# EasyEDA Pro project 稳流源电路板_2026-10-23.epro

# Schematic DC-DC-CV-学生版
Board Name: 稳压源; Create Date: 2025-10-15; Page Name: DC-DC-CV; Project Name: 3A稳压源_学生版; Schematic Name: DC-DC-CV-学生版; Update Date: 2025-10-15; Company: 嘉立创EDA; Page Size: A4; Version: V1.0
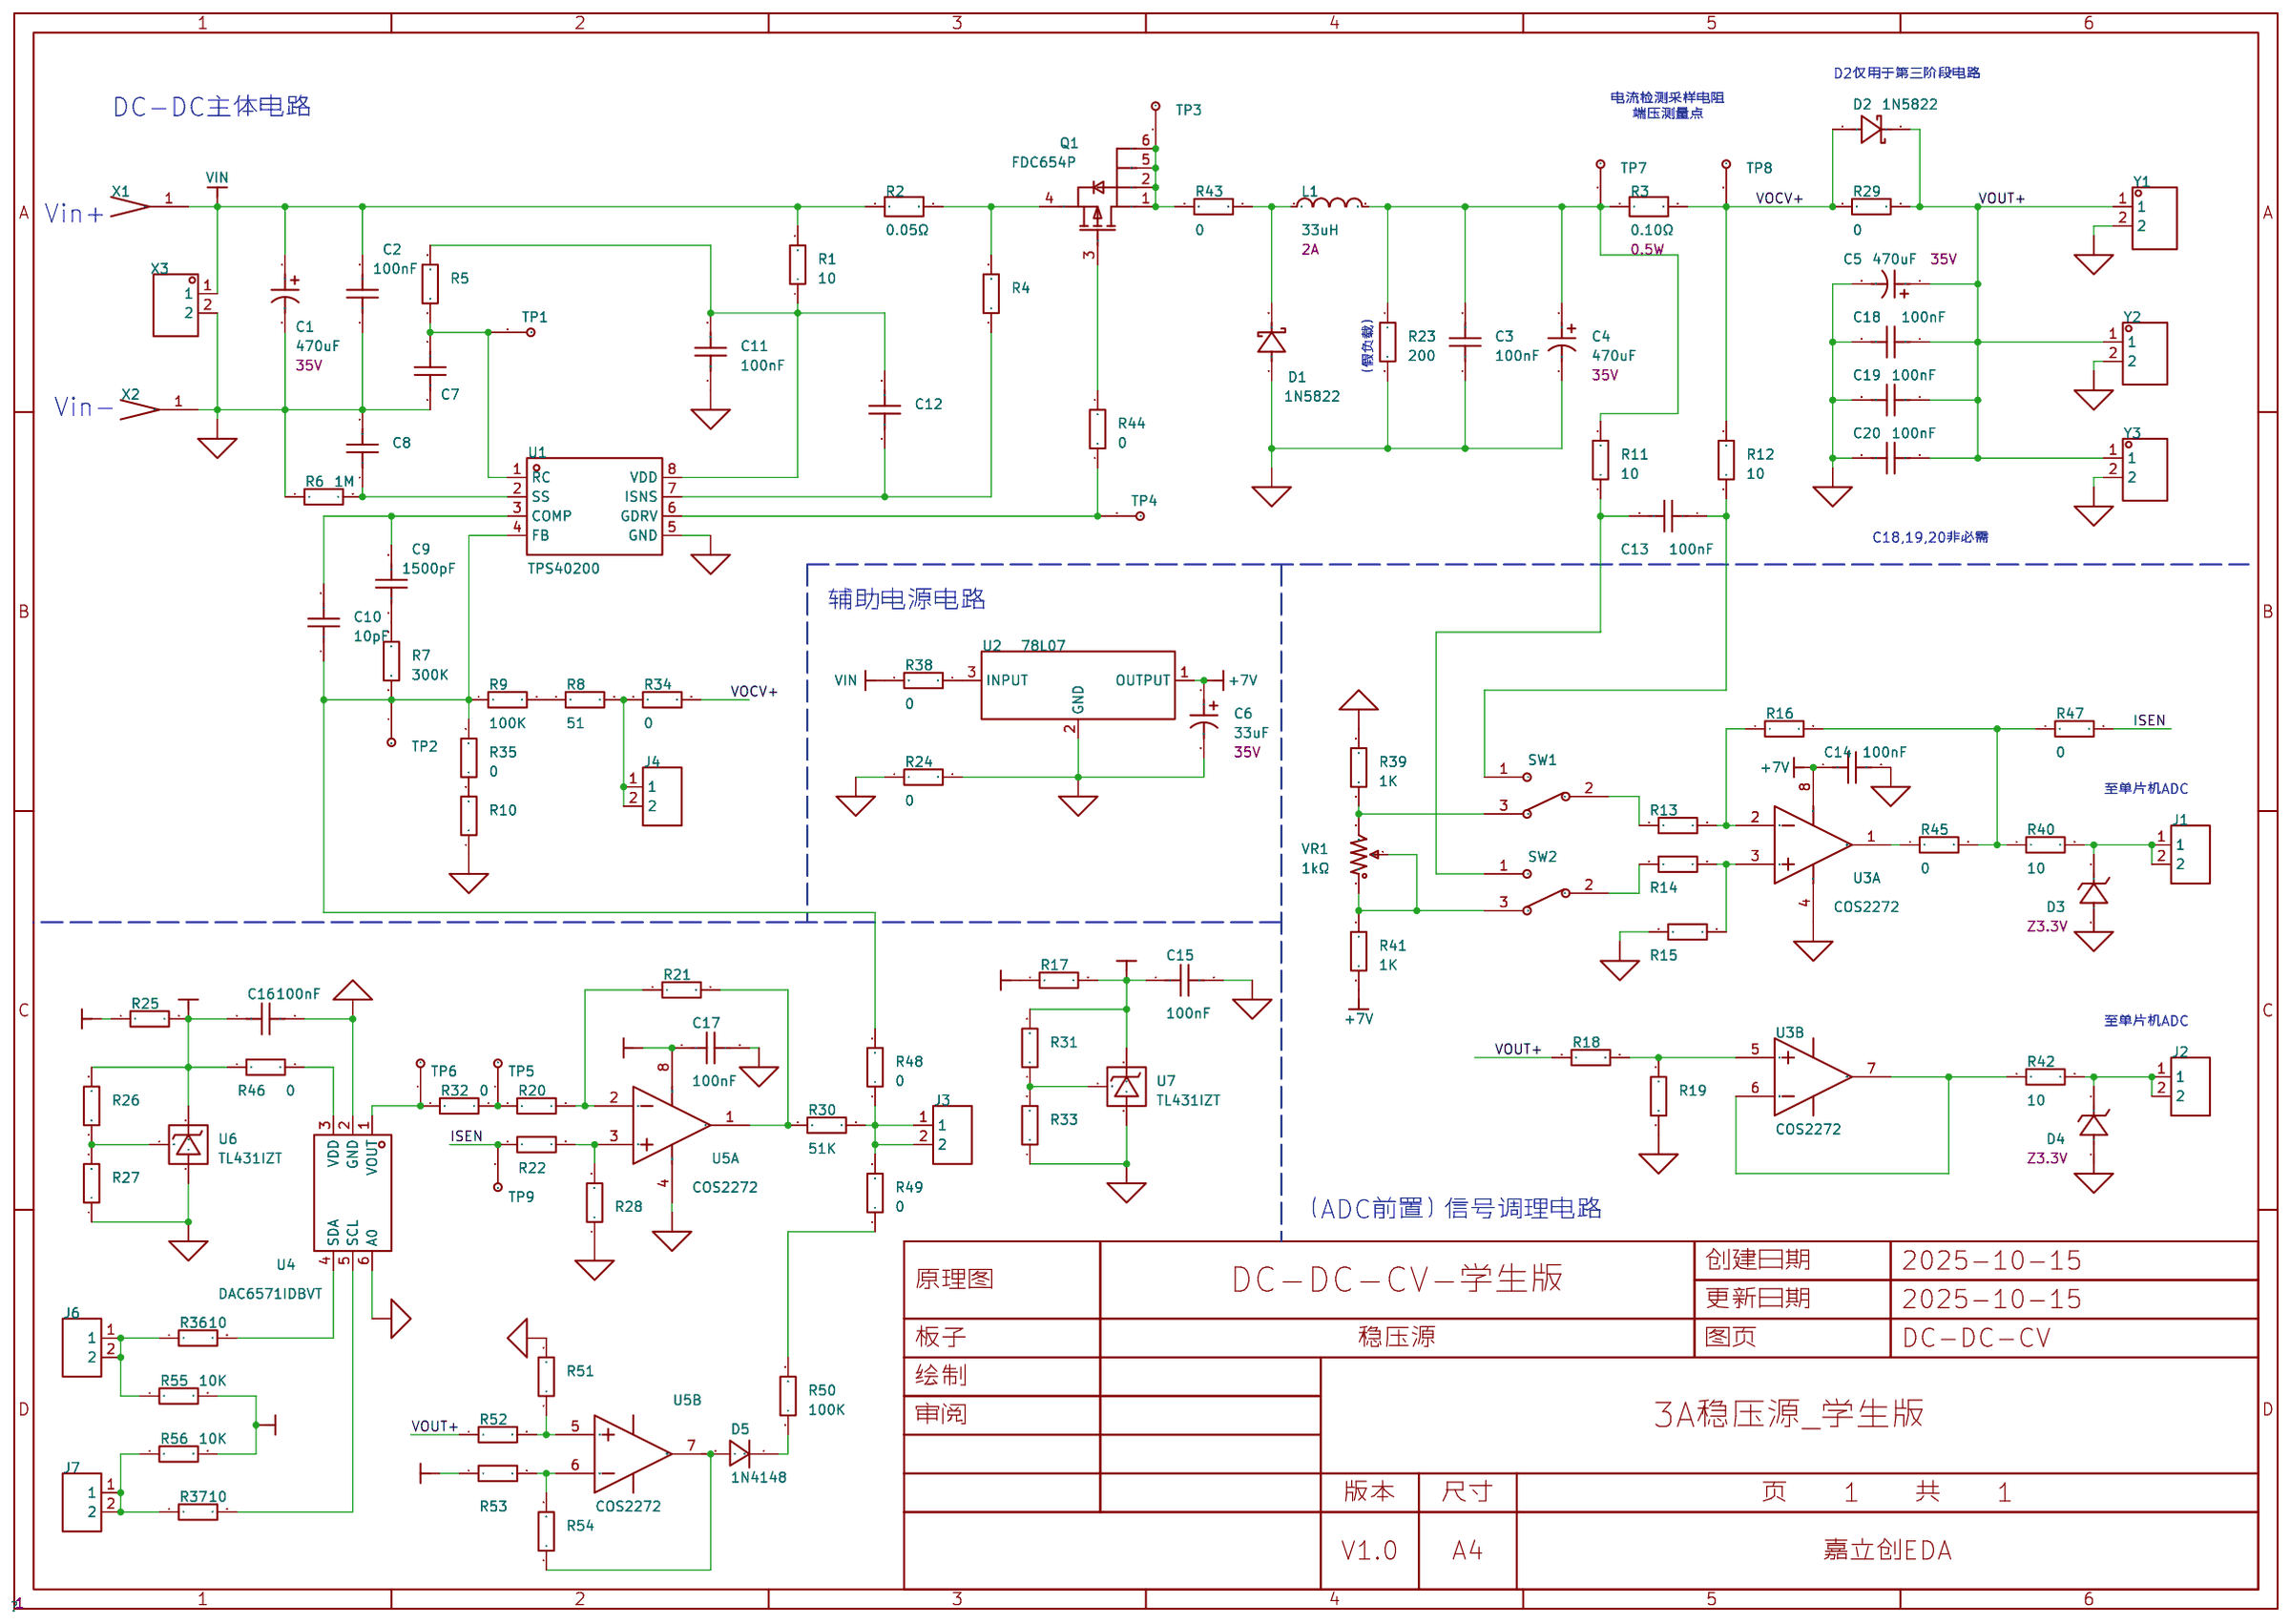
[diagram p0: schematic sheet]

## Parts
C1  470uF  [CAP-TH_BD10.0-P5.00-D0.6-FD]
C2  100nF  [C0805]
C3  100nF  [C0805]
C4  470uF  [CAP-TH_BD10.0-P5.00-D0.6-FD]
C5  470uF  [CAP-TH_BD10.0-P5.00-D0.6-FD]
C6  33uF  [CAP-TH_BD10.0-P5.00-D0.6-FD]
C7  100nF  [C0805]
C8  100nF  [C0805]
C9  1500pF  [C0805]
C10  10pF  [C0805]
C11  100nF  [C0805]
C12  100nF  [C0805]
C13  100nF  [C0805]
C14  100nF  [C0805]
C15  100nF  [C0805]
C16  100nF  [C0805]
C17  100nF  [C0805]
C18  100nF  [C0805]
C19  100nF  [C0805]
C20  100nF  [C0805]
D1  1N5822  [DO-201AD_BD5.3-L8.4-P12.50-D1.4-FD]
D2  1N5822  [DO-201AD_BD5.3-L8.4-P12.50-D1.4-FD]
D3  1N5937BRLG  [DO-41_BD2.4-L4.7-P8.70-D0.9-RD]
D4  1N5937BRLG  [DO-41_BD2.4-L4.7-P8.70-D0.9-RD]
D5  1N4148  [DO-35_BD2.0-L4.2-P8.20-D0.5-RD]
J1  PZ254V-11-02P  [HDR-TH_2P-P2.54-V-M]
J2  PZ254V-11-02P  [HDR-TH_2P-P2.54-V-M]
J3  PZ254V-11-02P  [HDR-TH_2P-P2.54-V-M]
J4  PZ254V-11-02P  [HDR-TH_2P-P2.54-V-M]
J6  PZ254V-11-02P  [HDR-TH_2P-P2.54-V-M]
J7  PZ254V-11-02P  [HDR-TH_2P-P2.54-V-M]
L1  33uH  [IND-SMD_L12.3-W12.3]
Q1  FDC654P  [SOT-23-6_L2.9-W1.6-P0.95-LS2.8-BL]
R1  10  [R0805]
R2  0.05Ω  [R2512]
R3  0.10Ω  [R2512]
R4  10K  [R0805]
R5  10K  [R0805]
R6  1M  [R0805]
R7  300K  [R0805]
R8  51  [R0805]
R9  100K  [R0805]
R10  10K  [R0805]
R11  10  [R0805]
R12  10  [R0805]
R13  10K  [R0805]
R14  10K  [R0805]
R15  10K  [R0805]
R16  10K  [R0805]
R17  10K  [R0805]
R18  10K  [R0805]
R19  10K  [R0805]
R20  10K  [R0805]
R21  10K  [R0805]
R22  10K  [R0805]
R23  200  [R0805]
R24  0  [R0805]
R25  10K  [R0805]
R26  10K  [R0805]
R27  10K  [R0805]
R28  10K  [R0805]
R29  0  [R0805]
R30  51K  [R0805]
R31  10K  [R0805]
R32  0  [R0805]
R33  10K  [R0805]
R34  0  [R0805]
R35  0  [R0805]
R36  10  [R0805]
R37  10  [R0805]
R38  0  [R0805]
R39  1K  [R0805]
R40  10  [R0805]
R41  1K  [R0805]
R42  10  [R0805]
R43  0  [R0805]
R44  0  [R0805]
R45  0  [R0805]
R46  0  [R0805]
R47  0  [R0805]
R48  0  [R0805]
R49  0  [R0805]
R50  100K  [R0805]
R51  10K  [R0805]
R52  10K  [R0805]
R53  10K  [R0805]
R54  10K  [R0805]
R55  10K  [R0805]
R56  10K  [R0805]
SW1  -  [3PIN]
SW2  -  [3PIN]
TP1  -  [1PIN]
TP2  -  [1PIN]
TP3  -  [1PIN]
TP4  -  [1PIN]
TP5  -  [1PIN]
TP6  -  [1PIN]
TP7  -  [1PIN]
TP8  -  [1PIN]
TP9  -  [1PIN]
U1  TPS40200  [SOIC-8_L4.9-W3.9-P1.27-LS6.0-BL]
U2  78L07  [TO-92-3_L4.8-W3.7-P1.27-L]
U3  COS2272  [SOIC-8_L4.9-W3.9-P1.27-LS6.0-BL]  (sections 1,2)
U4  DAC6571IDBVT  [SOT-23-6_L2.9-W1.6-P0.95-LS2.8-BL]
U5  COS2272  [SOIC-8_L4.9-W3.9-P1.27-LS6.0-BL]  (sections 1,2)
U6  TL431IZT  [TO-92-3_L5.1-W4.1-P1.27-L]
U7  TL431IZT  [TO-92-3_L5.1-W4.1-P1.27-L]
VR1  1kΩ  [RES-ADJ-TH_3P-L10.0-W10.0-P2.50-BL-BS]
X1  -  [HOLE6-13]
X2  -  [HOLE6-13]
X3  WJ2EDGV-5.08-2P  [CONN-TH_WJ2EDGV-5.08-2P]
Y1  WJ2EDGV-5.08-2P  [CONN-TH_WJ2EDGV-5.08-2P]
Y2  WJ2EDGV-5.08-2P  [CONN-TH_WJ2EDGV-5.08-2P]
Y3  WJ2EDGV-5.08-2P  [CONN-TH_WJ2EDGV-5.08-2P]

## Library data of the parts
C1 C4-C6 = EKZE350ELL471MJ20S: 容值:470uF;精度:±20%;额定电压:35V;纹波电流:-;等效串联电阻:-;; LCSC Part Name: 470uF ±20% 35V; Supplier Part: C1579354; Manufacturer: NCC(日本贵弥功); Supplier Footprint: 插件,D10xL20mm; JLCPCB Part Class: 扩展库; Datasheet: https://atta.szlcsc.com/upload/public/pdf/source/20210702/C1579354_DE4BD1676235DEE98D4DD079E73A87D2.pdf; Supplier: LCSC; Tolerance: ±20%; Rated Voltage: 35V
C2 C3 C7-C20 = CAP_0805: Supplier Footprint: 0805
D1 D2 = 1N5822_C27636119: Supplier Part: C27636119; Manufacturer: DOWO(东沃); Supplier Footprint: DO-201AD; JLCPCB Part Class: 扩展库; Datasheet: https://atta.szlcsc.com/upload/public/pdf/source/20240708/778E8DD7D26CDCB4892658A16A41E3F5.pdf; Supplier: LCSC
D3 D4 = 1N5937BRLG: 稳压值(标称值):33V;功率(Pd):3W;; Supplier Part: C896122; Manufacturer: onsemi(安森美); Supplier Footprint: 插件; JLCPCB Part Class: 扩展库; Datasheet: https://atta.szlcsc.com/upload/public/pdf/source/20221020/F23089D807D0452AE77C34D51C0B0686.pdf; Supplier: LCSC; Zener Voltage (Nom): 33V; Reverse Leakage Current (Ir): 1uA@25.1V; Power Dissipation: 3W; Zener Impedance (Zzt): 33Ω; Comment: Z3.3V
D5 = 1N4148_C402212: 二极管配置:-;正向压降(Vf):1V@10mA;直流反向耐压(Vr):75V;整流电流:150mA;反向恢复时间(Trr):4ns;; LCSC Part Name: 75V 150mA; Supplier Part: C402212; Manufacturer: LGE(鲁光); Supplier Footprint: DO-35; JLCPCB Part Class: Extended Part; Datasheet: https://item.szlcsc.com/datasheet/1N4148/387357.html; Supplier: LCSC; Voltage - Forward(Vf@If): 1V@10mA; Voltage - DC Reverse(Vr): 75V; Current - Rectified: 150mA; Pd - Power Dissipation: 500mW; Reverse Leakage Current (Ir): 5uA@75V; Reverse Recovery Time (trr): 4ns; Non-Repetitive Peak Forward Surge Current: 2A
J1-J4 J6 J7 = PZ254V-11-02P: 插针结构:1x2P;间距:2.54mm;行距:-;圆针/方针:方针;安装方式:直插;排数:单排;总PIN位数:2P;额定电流:-;额定电压:-;配合针长度:6mm;塑高:2.5mm;端接针长度:3mm;触头材质:黄铜;触头镀层:-;工作温度:-40℃~+105℃;颜色:黑色;; LCSC Part Name: 1x2P 间距:2.54mm 方针 直插; Supplier Part: C492401; Manufacturer: XFCN(兴飞); Supplier Footprint: 插件,P=2.54mm; JLCPCB Part Class: 扩展库; Datasheet: https://atta.szlcsc.com/upload/public/pdf/source/20200309/C492401_A812433581A9B211A7FFA413ADDFF0E5.pdf; Supplier: LCSC; Pin Structure: 1x2P; Pitch: 2.54mm; Circluar Pins/Square Pins: 方针; Mounting Type: 直插; Number of Rows: 单排; Number of Pins: 2P; Length of Mating Pin: 6mm; Insulation Height: 2.5mm; Length of End Connection Pin: 3mm; Contact Material: 黄铜; Operating Temperature: -40℃~+105℃; Color: 黑色
L1 = SMDRI127-330MT: 电感值:33uH;精度:±20%;额定电流:3A;饱和电流(Isat):5.5A;类型:屏蔽电感;; LCSC Part Name: 33uH ±20% 5.5A; Supplier Part: C9400; Manufacturer: SXN(顺翔诺); Supplier Footprint: SMD,12.3x12.3mm; JLCPCB Part Class: 扩展库; Datasheet: https://atta.szlcsc.com/upload/public/pdf/source/20210810/6F96FDC19AA308DD2AD166FFB9640E87.pdf; Supplier: LCSC; Tolerance: ±20%; Rated Current: 2A; Saturation Current (Isat): 5.5A; DC Resistance (DCR): 65mΩ; Type: 屏蔽电感
Q1 = TPFDC654P: Supplier Part: C5246409; Manufacturer: TECH PUBLIC(台舟); Supplier Footprint: SOT-23-6; JLCPCB Part Class: Extended Part; Datasheet: https://atta.szlcsc.com/upload/public/pdf/source/20221103/A89DD7696F31491652C9E5A0C36A9DE5.pdf; Supplier: LCSC
R1 R4-R56 = Res_0805: Supplier Footprint: 0805
R2 = JER2512F3R050: 电阻类型:采样电阻;阻值:50mΩ;精度:±1%;功率:3W;温度系数:±50ppm/℃;; LCSC Part Name: 50mΩ 3W 2512 ±1%; Supplier Part: C46634452; Manufacturer: 捷而瑞; Supplier Footprint: 2512; JLCPCB Part Class: 扩展库; Datasheet: https://atta.szlcsc.com/upload/public/pdf/source/20250318/D554CC95569B02A455FAE3D181D671EA.pdf; Supplier: LCSC; Type: 采样电阻; Tolerance: ±1%; Power(Watts): 3W; Temperature Coefficient: ±50ppm/℃
R3 = RE2512F3R100: 电阻类型:采样电阻;阻值:100mΩ;精度:±1%;功率:3W;温度系数:±50ppm/℃;; LCSC Part Name: 100mΩ 3W 2512 ±1%; Supplier Part: C46961760; Manufacturer: 捷而瑞; Supplier Footprint: 2512; JLCPCB Part Class: 扩展库; Datasheet: https://atta.szlcsc.com/upload/public/pdf/source/20250325/401775B85EF7B3A580BC34DFED100CB2.pdf; Supplier: LCSC; Type: 采样电阻; Tolerance: ±1%; Power(Watts): 0.5W; Temperature Coefficient: ±50ppm/℃
SW1 SW2 = SW-3
TP1-TP9 = TESTPOINT
U1 = TPS40200D: 功能类型:降压型;输入电压:4.5V~52V;; Supplier Part: C1530060; Manufacturer: TI(德州仪器); Supplier Footprint: SOIC-8; JLCPCB Part Class: Extended Part; Datasheet: https://www.ti.com/cn/lit/gpn/tps40200; Supplier: LCSC; Function: 降压型; Input Voltage: 4.5V~52V; Switching Frequency: 500kHz; Operating Temperature: -40℃~+85℃@(TA); Synchronous Rectification: 否; Number of Outputs: 1; Topology: 降压式; Switch tube (built-in/external): 外置
U2 = UPC78L07J-T-A: Supplier Part: C3749755; Manufacturer: RENESAS(瑞萨)/IDT; JLCPCB Part Class: 扩展库; Supplier: LCSC
U3 U5 = TLV2372IDRG4: TLV2372 双路、16V、3MHz、RRIO 运算放大器; Supplier Part: C2058264; Manufacturer: TI(德州仪器); Supplier Footprint: SOIC-8; JLCPCB Part Class: 扩展库; Datasheet: https://www.ti.com/cn/lit/gpn/tlv2375; Supplier: LCSC
U4 = DAC6571IDBVT: 分辨率(位):10位;接口类型:I2C;工作电压:2.7V~5.5V;稳定时间:7us;积分非线性:0.5LSB;; LCSC Part Name: I2C接口、电压输出、10位数字模拟转换器; Supplier Part: C1554794; Manufacturer: TI(德州仪器); Supplier Footprint: SOT-23-6; JLCPCB Part Class: Extended Part; Datasheet: https://www.ti.com/cn/lit/gpn/dac6571; Supplier: LCSC; Resolution(Bits): 10位; Number of Channels: 1; Interface: I2C; Voltage - Supply: 2.7V~5.5V; Settling Time: 7us; Output Type: 电压-缓冲; Integral non - linearity: 0.5LSB; Operating Temperature: -40℃~+105℃; Power-On Reset: 内置; Sampling Rate: 188kHz; Data rate: 3.4MHz; Quiescent Current (Iq): 125uA
U6 U7 = TL431IZT: 输出类型:可调;工作电压:2.5V~36V;输出电压:2.495V~36V;输出电流:100mA;精度:±2%;; LCSC Part Name: 2.5V~36V 并联; Supplier Part: C2156686; Manufacturer: ST(意法半导体); Supplier Footprint: TO-92; JLCPCB Part Class: Extended Part; Datasheet: https://item.szlcsc.com/datasheet/TL431IZT/2248735.html; Supplier: LCSC; Output Type: 可调; Voltage - Supply: 2.5V~36V; Output Voltage: 2.495V~36V; Output Current: 100mA; Tolerance: ±2%; Reference Type: 并联; Minimum Cathode Current for Regulation: 500uA; Operating Temperature: -40℃~+105℃@(Ta)
VR1 = 3296W-1-102: 阻值:1kΩ;精度:±10%;; LCSC Part Name: 1kΩ ±10%; Supplier Part: C118949; Manufacturer: BOCHEN(博晨); Supplier Footprint: 插件; JLCPCB Part Class: 扩展库; Datasheet: https://atta.szlcsc.com/upload/public/pdf/source/20171114/C118949_15106326635991117438.pdf; Supplier: LCSC; Tolerance: ±10%
X1 X2 = 香蕉插座
X3 Y1-Y3 = WJ2EDGV-5.08-2P: 连接器类型:板端/插座-开口;固定方式:-;结构:1x2P;间距:5.08mm;颜色:绿色;安装方式:直针;排数:1;每排PIN数:2;额定电流:20A;额定电压:450V;线规 - AWG:-;线规 - 平方毫米:-;触头材质:黄铜;触头镀层:锡;工作温度范围:-40℃~+105℃;焊接温度(最大值):-;; LCSC Part Name: 1x2P 5.08mm 排数:1 每排P数:2; Supplier Part: C8461; Manufacturer: KANGNEX(康奈克斯电气); Supplier Footprint: 插件,P=5.08mm; JLCPCB Part Class: 扩展库; Datasheet: https://atta.szlcsc.com/upload/public/pdf/source/20191225/C8461_177EB00EC60F9C1AD12B590D31C8666C.pdf; Supplier: LCSC; Connector Type: 板端/插座-开口; Structure: 1x2P; Pitch: 5.08mm; Color: 绿色; Mounting Style: 直针; Number of Pins: 2P; Number of Rows: 1; Number of PINs Per Row: 2; Current Rating (Max): 20A; Voltage Rating (Max): 450V; Contact Material: 黄铜; Contact Plating: 锡; Operating Temperature Range: -40℃~+105℃

## Nets
+3.3VREF: C16.1 R25.2 R26.2 R46.1 R55.2 R56.2 U6.3(C)
+5VREF: C15.1 R17.2 R31.2 R53.1 U7.3(C)
+7V: C6.1 C14.1 C17.1 R17.1 R25.1 R41.2 U2.1(OUTPUT) U3.8(VDD) U5.8(VDD)
GND: C1.2 C2.1 C3.1 C4.2 C5.2 C7.1 C8.2 C11.1 C18.2 C19.2 C20.1 D1.1(A) R6.1 R10.1 R23.2 R24.1 U1.5(GND) X2.1 X3.2 Y1.2 Y2.2 Y3.2
GND1: C6.2 C14.2 C15.2 C16.2 C17.2 D3.2(A) D4.2(A) R15.1 R19.2 R24.2 R27.1 R28.1 R33.1 R39.1 R51.2 U2.2(GND) U3.4(GND) U4.2(GND) U4.6(A0) U5.4(GND) U6.2(A) U7.2(A)
VIN: C1.1 C2.2 R1.2 R2.1 R38.2 X1.1 X3.1
ISEN: R22.1 R47.2 TP9.1
VOCV+: D2.1(A) R3.2 R12.1 R29.1 R34.2 TP8.1
VOUT+: C5.1 C18.1 C19.1 C20.2 D2.2(K) R18.1 R29.2 R52.1 Y1.1 Y2.1 Y3.1
$3N1094: C7.2 R5.1 TP1.1 U1.1(RC)
$3N1131: C8.1 R6.2 U1.2(SS)
$3N1241: R8.1 R9.2
$3N1420: J4.1 J4.2 R8.2 R34.1
$3N1514: C11.2 C12.2 R1.1 R5.2 U1.8(VDD)
$3N1540: C12.1 R4.1 U1.7(ISNS)
$3N1601: Q1.4(S) R2.2 R4.2
$3N1728: Q1.3(G) R44.2
$3N1757: Q1.1(D) Q1.2(D) Q1.5(D) Q1.6(D) R43.2 TP3.1
$3N2008: D1.2(K) L1.1 R43.1
$3N2012: C3.2 C4.1 L1.2 R3.1 R11.2 R23.1 TP7.1
$3N3426: R13.2 R16.1 U3.2(IN1-)
$3N3428: R14.2 R15.2 U3.3(IN1+)
$3N3448: R45.1 U3.1(OUT1)
$3N3452: R16.2 R40.1 R45.2 R47.1
$3N3515: D3.1(C) J1.1 J1.2 R40.2
$3N5937: R13.1 SW1.2
$3N5942: R14.1 SW2.2
$3N5986: C13.1 R12.2 SW1.1
$3N5991: C13.2 R11.1 SW2.1
$3N6177: D4.1(C) J2.1 J2.2 R42.2
$3N6196: R18.2 R19.1 U3.5(IN2+)
$3N6313: R39.2 SW1.3 VR1.3
$3N6315: R41.1 SW2.3 VR1.1 VR1.2
$3N6870: C9.1 R7.2
$3N24683: R44.1 TP4.1 U1.6(GDRV)
$3N24701: C9.2 C10.2 U1.3(COMP)
$3N24711: C10.1 R7.1 R9.1 R35.2 R48.2 TP2.1 U1.4(FB)
$3N24744: R38.1 U2.3(INPUT)
$3N33315: R10.2 R35.1
$3N34791: R42.1 U3.6(IN2-) U3.7(OUT2)
$3N34794: R26.1 R27.2 U6.1(REF)
$3N34796: R46.2 U4.3(VDD)
$3N34806: R31.1 R33.2 U7.1(REF)
$3N34809: R32.1 TP6.1 U4.1(VOUT)
$3N34810: R20.1 R32.2 TP5.1
$3N34811: R20.2 R21.1 U5.2(IN1-)
$3N34816: R22.2 R28.2 U5.3(IN1+)
$3N34819: R21.2 R30.1 U5.1(OUT1)
$3N34820: J3.1 J3.2 R30.2 R48.1 R49.2
$3N34821: R53.2 R54.2 U5.6(IN2-)
$3N34822: D5.2(A) R54.1 U5.7(OUT2)
$3N34823: D5.1(C) R50.1
$3N34824: R49.1 R50.2
$3N34825: R51.1 R52.2 U5.5(IN2+)
$3N34829: J6.1 J6.2 R36.1 R55.1
$3N34830: R36.2 U4.4(SDA)
$3N34833: J7.1 J7.2 R37.1 R56.1
$3N34834: R37.2 U4.5(SCL)

## Notes on the sheet
- D2仅用于第三阶段电路
- 电流检测采样电阻
  端压测量点
- DC-DC主体电路
- Vin+
- （假负载）
- Vin-
- C18,19,20非必需
- 辅助电源电路
- 至单片机ADC
- 至单片机ADC
- （ADC前置）信号调理电路

# Board PCB1
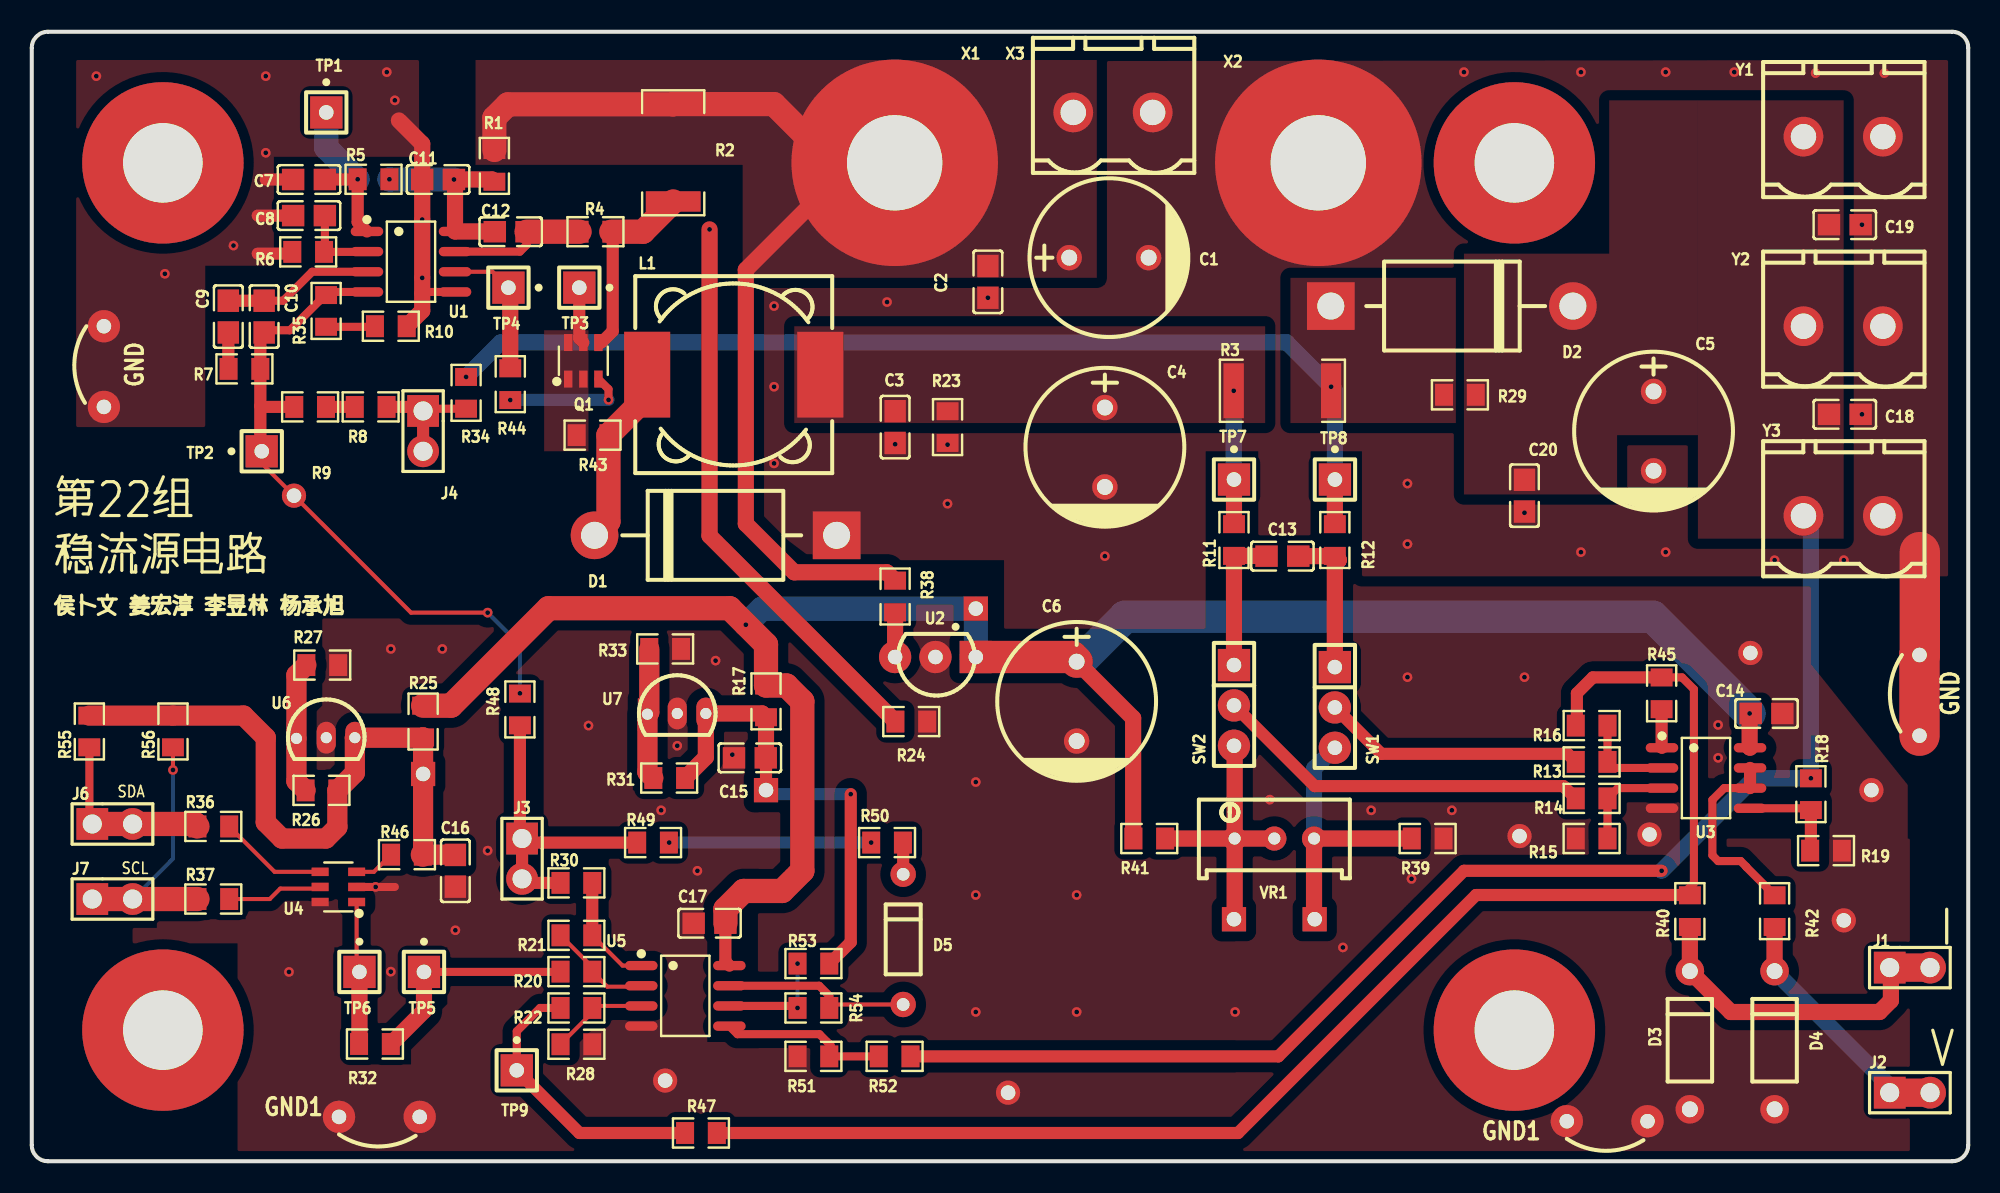
[diagram p1: board, top side]
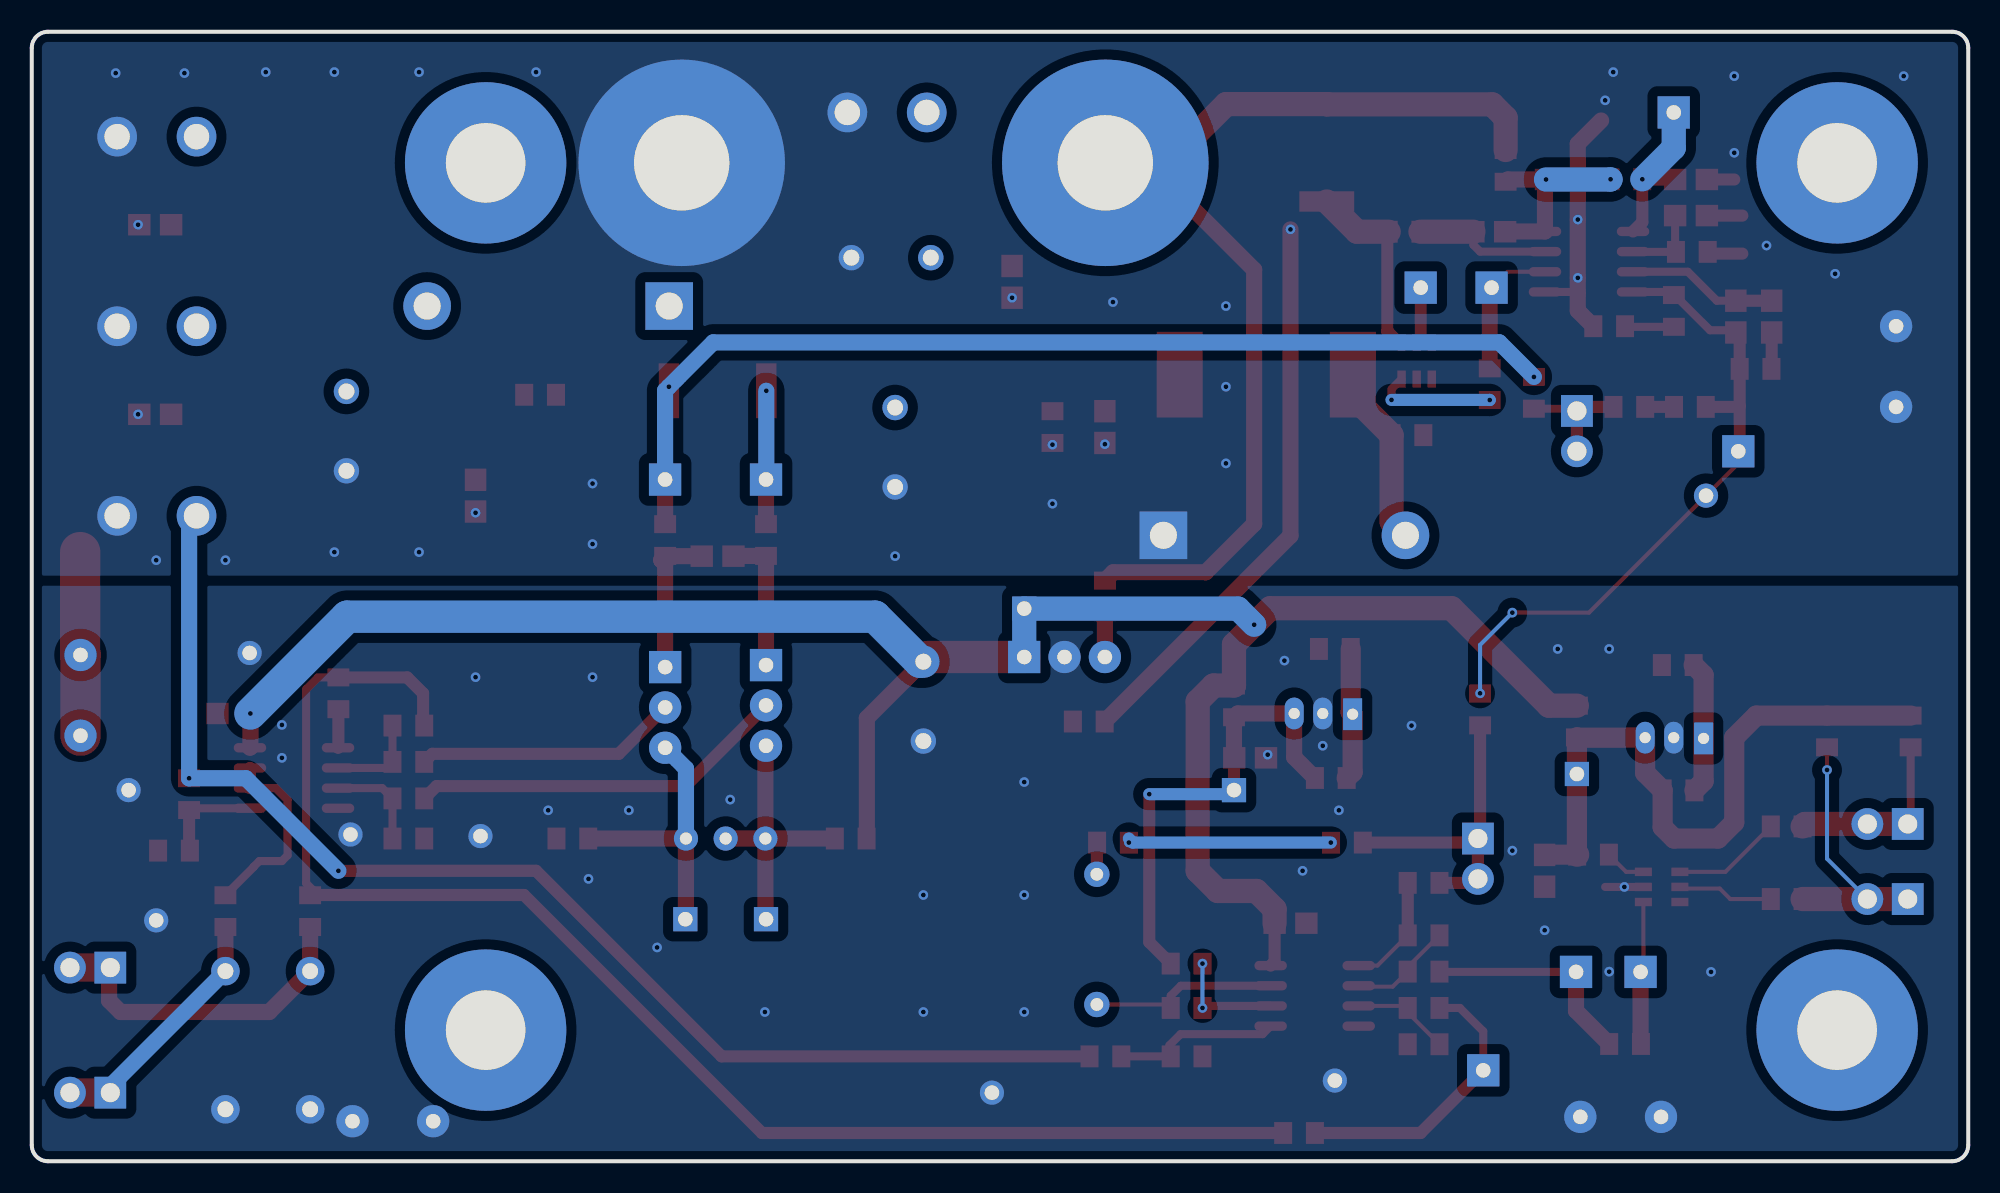
[diagram p2: board, bottom side, seen from below]

Outline 121.92 x 71.12 mm; copper layers: Top Layer, Bottom Layer. Coordinates in mm from the lower left corner of the outline.
Outline path: 0,70.1 0,1.02 arc(0.3,0.3) 1.02,0 120.9,0 arc(121.62,0.3) 121.92,1.02 121.92,70.1 arc(121.62,70.82) 120.9,71.12 1.02,71.12 arc(0.3,70.82) 0,70.1
Stack: Top Layer 0.035mm / Dielectric1 1.51mm FR4 er 4.5 / Bottom Layer 0.035mm

## Design rules (mm)
spacing copperThickness1oz (default): track to track 0.102, other pairs 0.152 to 0.3
spacing copperThickness2oz: track to track 0.203, other pairs 0.152 to 0.3
spacing Plane_innerPlane: track to track 0.102, other pairs 0.152 to 0.3
spacing Copper_copperRegion: track to track 0.102, other pairs 0.152 to 0.3
spacing Copper_copperRegion1: track to track 0.102, other pairs 0.152 to 0.3
track width copperThickness1oz (default): min 0.127, default 0.254, max 2.54
track width copperThickness2oz: min 0.203, default 0.254, max 2.54
differential pair differentialPair (default): width min 0.127, default 0.254, max 2.54; gap min 0.152, default 0.152
net GND1 uses copperRegion
net GND uses copperRegion
net $3N34816 uses copperRegion

## Placement (name value [footprint] x y rotation side)
C1  470uF  [CAP-TH_BD10.0-P5.00-D0.6-FD]  67.82 56.9 0 top
C2  100nF  [C0805]  60.2 55.37 90 top
C3  100nF  [C0805]  54.36 46.23 90 top
C4  470uF  [CAP-TH_BD10.0-P5.00-D0.6-FD]  67.56 44.96 270 top
C5  470uF  [CAP-TH_BD10.0-P5.00-D0.6-FD]  102.11 45.97 270 top
C6  33uF  [CAP-TH_BD10.0-P5.00-D0.6-FD]  65.79 28.96 270 top
C7  100nF  [C0805]  17.45 61.82 0 top
C8  100nF  [C0805]  17.45 59.55 180 top
C9  1500pF  [C0805]  12.37 53.18 90 top
C10  10pF  [C0805]  14.63 53.18 90 top
C11  100nF  [C0805]  25.58 61.82 0 top
C12  100nF  [C0805]  30.15 58.53 180 top
C13  100nF  [C0805]  78.74 38.1 180 top
C14  100nF  [C0805]  109.22 28.19 0 top
C15  100nF  [C0805]  45.21 25.4 180 top
C16  100nF  [C0805]  26.67 18.29 270 top
C17  100nF  [C0805]  42.67 14.99 180 top
C18  100nF  [C0805]  114.15 47.03 0 top
C19  100nF  [C0805]  114.15 58.97 0 top
C20  100nF  [C0805]  93.98 41.91 90 top
D1  1N5822  [DO-201AD_BD5.3-L8.4-P12.50-D1.4-FD]  43.05 39.41 180 top
D2  1N5822  [DO-201AD_BD5.3-L8.4-P12.50-D1.4-FD]  89.41 53.85 0 top
D3  1N5937BRLG  [DO-41_BD2.4-L4.7-P8.70-D0.9-RD]  104.39 7.62 270 top
D4  1N5937BRLG  [DO-41_BD2.4-L4.7-P8.70-D0.9-RD]  109.73 7.62 270 top
D5  1N4148  [DO-35_BD2.0-L4.2-P8.20-D0.5-RD]  54.86 13.97 270 top
J1  PZ254V-11-02P  [HDR-TH_2P-P2.54-V-M]  118.25 12.19 0 top
J2  PZ254V-11-02P  [HDR-TH_2P-P2.54-V-M]  118.25 4.32 0 top
J3  PZ254V-11-02P  [HDR-TH_2P-P2.54-V-M]  30.87 19.05 270 top
J4  PZ254V-11-02P  [HDR-TH_2P-P2.54-V-M]  24.64 45.97 270 top
J6  PZ254V-11-02P  [HDR-TH_2P-P2.54-V-M]  5.08 21.24 0 top
J7  PZ254V-11-02P  [HDR-TH_2P-P2.54-V-M]  5.08 16.51 0 top
L1  33uH  [IND-SMD_L12.3-W12.3]  44.2 49.53 0 top
NOREF  -  [Pad_e14]  46.23 23.37 0 top
NOREF#2  -  [Pad_e6]  24.42 2.79 0 top
NOREF#3  -  [Pad_e1]  8.25 8.25 0 top
NOREF#4  -  [Pad_e12]  4.54 52.58 270 top
NOREF#5  -  [Pad_e8]  118.85 26.8 270 top
NOREF#6  -  [Pad_e16]  75.69 15.24 0 top
NOREF#7  -  [Pad_e3]  93.34 62.86 0 top
NOREF#8  -  [Pad_e5]  19.34 2.79 0 top
NOREF#9  -  [Pad_e13]  16.51 41.91 0 top
NOREF#10  -  [Pad_e928]  39.88 5.08 0 top
NOREF#11  -  [Pad_e910]  93.67 20.47 0 top
NOREF#12  -  [Pad_e7]  118.85 31.88 270 top
NOREF#13  -  [Pad_e11]  4.54 47.5 270 top
NOREF#14  -  [Pad_e929]  61.47 4.32 0 top
NOREF#15  -  [Pad_e915]  115.82 23.37 0 top
NOREF#16  -  [Pad_e9]  96.65 2.52 0 top
NOREF#17  -  [Pad_e10]  101.73 2.52 0 top
NOREF#18  -  [Pad_e18]  24.64 24.38 0 top
NOREF#19  -  [Pad_e4]  93.34 8.25 0 top
NOREF#20  -  [Pad_e911]  108.2 32 0 top
NOREF#21  -  [Pad_e17]  80.77 15.24 0 top
NOREF#22  -  [Pad_e15]  59.44 34.8 0 top
NOREF#23  -  [Pad_e2]  8.25 62.86 0 top
NOREF#24  -  [Pad_e914]  114.09 15.17 0 top
NOREF#25  -  [Pad_e909]  101.85 20.57 0 top
Q1  FDC654P  [SOT-23-6_L2.9-W1.6-P0.95-LS2.8-BL]  34.73 50.4 0 top
R1  10  [R0805]  29.13 62.67 90 top
R2  0.05Ω  [R2512]  40.39 63.5 270 top
R3  0.10Ω  [R2512]  78.74 48.51 0 top
R4  10K  [R0805]  35.49 58.53 0 top
R5  10K  [R0805]  21.52 61.83 0 top
R6  1M  [R0805]  17.4 57.26 0 top
R7  300K  [R0805]  13.39 49.89 180 top
R8  51  [R0805]  21.34 47.5 0 top
R9  100K  [R0805]  17.53 47.5 0 top
R10  10K  [R0805]  22.61 52.58 180 top
R11  10  [R0805]  75.69 39.12 90 top
R12  10  [R0805]  82.04 39.12 270 top
R13  10K  [R0805]  98.21 25.15 0 top
R14  10K  [R0805]  98.21 22.85 0 top
R15  10K  [R0805]  98.21 20.32 0 top
R16  10K  [R0805]  98.21 27.43 180 top
R17  10K  [R0805]  46.23 28.96 270 top
R18  10K  [R0805]  112.01 23.11 270 top
R19  10K  [R0805]  112.97 19.56 0 top
R20  10K  [R0805]  34.29 11.94 0 top
R21  10K  [R0805]  34.29 14.22 0 top
R22  10K  [R0805]  34.29 9.65 0 top
R23  200  [R0805]  57.66 46.23 270 top
R24  0  [R0805]  55.37 27.69 0 top
R25  10K  [R0805]  24.64 27.69 270 top
R26  10K  [R0805]  18.24 23.35 0 top
R27  10K  [R0805]  18.29 31.24 180 top
R28  10K  [R0805]  34.29 7.37 180 top
R29  0  [R0805]  89.92 48.26 0 top
R30  51K  [R0805]  34.29 17.53 180 top
R31  10K  [R0805]  40.13 24.13 0 top
R32  0  [R0805]  21.61 7.38 0 top
R33  10K  [R0805]  39.88 32.26 180 top
R34  0  [R0805]  27.34 48.39 90 top
R35  0  [R0805]  18.53 53.54 90 top
R36  10  [R0805]  11.43 21.08 0 top
R37  10  [R0805]  11.43 16.51 0 top
R38  0  [R0805]  54.36 35.56 90 top
R39  1K  [R0805]  87.88 20.32 180 top
R40  10  [R0805]  104.39 15.75 270 top
R41  1K  [R0805]  70.36 20.32 180 top
R42  10  [R0805]  109.73 15.75 270 top
R43  0  [R0805]  35.31 45.72 180 top
R44  0  [R0805]  30.13 48.93 270 top
R45  0  [R0805]  102.62 29.46 90 top
R46  0  [R0805]  23.62 19.3 180 top
R47  0  [R0805]  42.13 1.78 180 top
R48  0  [R0805]  30.73 28.45 90 top
R49  0  [R0805]  39.12 20.07 180 top
R50  100K  [R0805]  53.85 20.07 180 top
R51  10K  [R0805]  49.21 6.6 180 top
R52  10K  [R0805]  54.32 6.6 180 top
R53  10K  [R0805]  49.21 12.45 180 top
R54  10K  [R0805]  49.21 9.65 180 top
R55  10K  [R0805]  3.62 27.06 90 top
R56  10K  [R0805]  8.89 27.06 90 top
SW1  -  [3PIN]  82.04 31.11 270 top
SW2  -  [3PIN]  75.69 31.24 270 top
TP1  -  [1PIN]  18.54 66.04 180 top
TP2  -  [1PIN]  14.48 44.7 270 top
TP3  -  [1PIN]  34.47 55.01 90 top
TP4  -  [1PIN]  30.01 55.01 90 top
TP5  -  [1PIN]  24.69 11.92 180 top
TP6  -  [1PIN]  20.63 11.92 180 top
TP7  -  [1PIN]  75.69 42.93 180 top
TP8  -  [1PIN]  82.05 42.93 180 top
TP9  -  [1PIN]  30.54 5.72 180 top
U1  TPS40200  [SOIC-8_L4.9-W3.9-P1.27-LS6.0-BL]  23.88 56.64 270 top
U2  78L07  [TO-92-3_L4.8-W3.7-P1.27-L]  56.9 31.75 180 top
U3  COS2272  [SOIC-8_L4.9-W3.9-P1.27-LS6.0-BL]  105.41 24.13 270 top
U4  DAC6571IDBVT  [SOT-23-6_L2.9-W1.6-P0.95-LS2.8-BL]  19.3 17.27 90 top
U5  COS2272  [SOIC-8_L4.9-W3.9-P1.27-LS6.0-BL]  41.15 10.41 270 top
U6  TL431IZT  [TO-92-3_L5.1-W4.1-P1.27-L]  18.54 26.67 0 top
U7  TL431IZT  [TO-92-3_L5.1-W4.1-P1.27-L]  40.64 28.19 0 top
VR1  1kΩ  [RES-ADJ-TH_3P-L10.0-W10.0-P2.50-BL-BS]  78.23 20.32 90 top
X1  -  [HOLE6-13]  54.33 299.72 0 top
X2  -  [HOLE6-13]  81 299.72 0 top
X3  WJ2EDGV-5.08-2P  [CONN-TH_WJ2EDGV-5.08-2P]  68.07 66.04 0 top
Y1  WJ2EDGV-5.08-2P  [CONN-TH_WJ2EDGV-5.08-2P]  114.05 64.52 0 top
Y2  WJ2EDGV-5.08-2P  [CONN-TH_WJ2EDGV-5.08-2P]  114.05 52.58 0 top
Y3  WJ2EDGV-5.08-2P  [CONN-TH_WJ2EDGV-5.08-2P]  114.05 40.64 0 top

## Footprints (pads in the part's own frame, mm; a bottom-side part is the same pattern mirrored in y, then rotated)
1PIN
  rect 2.032x2.032 hole 0.914: 1(0,0)
3PIN
  rect 2.032x2.032 hole 0.914: 1(0,0)
  round 2.032 hole 0.914: 2(2.54,0) 3(5.08,0)
C0805
  rect 1.41x1.35 smd: 1(-1,0) 2(1,0)
CAP-TH_BD10.0-P5.00-D0.6-FD
  round 1.6 hole 1: 1(-2.5,0) 2(2.5,0)
CONN-TH_WJ2EDGV-5.08-2P
  round 2.5 hole 1.6: 1(-2.499,0) 2(2.499,0)
DO-35_BD2.0-L4.2-P8.20-D0.5-RD
  round 1.6 hole 0.8: 1(-4.1,0) 2(4.1,0)
DO-41_BD2.4-L4.7-P8.70-D0.9-RD
  round 1.8 hole 1: 1(-4.35,0) 2(4.35,0)
DO-201AD_BD5.3-L8.4-P12.50-D1.4-FD
  rect 3x3 hole 1.7: 1(-7.62,0)
  round 3 hole 1.7: 2(7.62,0)
HDR-TH_2P-P2.54-V-M
  rect 2x2 hole 1.2: 1(-1.27,0)
  round 2 hole 1.2: 2(1.27,0)
HOLE6-13
  round 13 hole 6: 1(0,-236.855)
IND-SMD_L12.3-W12.3
  rect 2.9x5.4 smd: 1(-5.45,0) 2(5.45,0)
Pad_e1
  round 10.16 hole 5.004: 1(0,0)
Pad_e2
  round 10.16 hole 5.004: 1(0,0)
Pad_e3
  round 10.16 hole 5.004: 1(0,0)
Pad_e4
  round 10.16 hole 5.004: 1(0,0)
Pad_e5
  round 2.032 hole 0.914: 1(0,0)
Pad_e6
  round 2.032 hole 0.914: 2(0,0)
Pad_e7
  round 2.032 hole 0.914: 1(0,0)
Pad_e8
  round 2.032 hole 0.914: 2(0,0)
Pad_e9
  round 2.032 hole 0.914: 1(0,0)
Pad_e10
  round 2.032 hole 0.914: 2(0,0)
Pad_e11
  round 2.032 hole 0.914: 2(0,0)
Pad_e12
  round 2.032 hole 0.914: 1(0,0)
Pad_e13
  round 1.524 hole 0.914: 1(0,0)
Pad_e14
  rect 1.524x1.524 hole 0.914: 1(0,0)
Pad_e15
  rect 1.524x1.524 hole 0.914: 1(0,0)
Pad_e16
  rect 1.524x1.524 hole 0.914: 1(0,0)
Pad_e17
  rect 1.524x1.524 hole 0.914: 2(0,0)
Pad_e18
  rect 1.524x1.524 hole 0.914: 1(0,0)
Pad_e909
  round 1.524 hole 0.914: 1(0,0)
Pad_e910
  round 1.524 hole 0.914: 2(0,0)
Pad_e911
  round 1.524 hole 0.914: 3(0,0)
Pad_e914
  round 1.524 hole 0.914: 1(0,0)
Pad_e915
  round 1.524 hole 0.914: 1(0,0)
Pad_e928
  round 1.524 hole 0.914: 1(0,0)
Pad_e929
  round 1.524 hole 0.914: 2(0,0)
R0805
  rect 1.133x1.377 smd: 1(-1,0) 2(1,0)
R2512
  rect 1.282x3.456 smd: 1(-3.067,0) 2(3.067,0)
RES-ADJ-TH_3P-L10.0-W10.0-P2.50-BL-BS
  round 1.524 hole 0.762: 1(0,2.5) 2(0,0) 3(0,-2.5)
SOIC-8_L4.9-W3.9-P1.27-LS6.0-BL
  oval 0.588x2.045 smd: 1(-1.905,-2.772) 2(-0.635,-2.772) 3(0.635,-2.772) 4(1.905,-2.772) 5(1.905,2.772) 6(0.635,2.772) 7(-0.635,2.772) 8(-1.905,2.772)
SOT-23-6_L2.9-W1.6-P0.95-LS2.8-BL
  rect 0.532x1.072 smd: 1(-0.95,-1.149) 2(0,-1.149) 3(0.95,-1.149) 4(0.95,1.149) 5(0,1.149) 6(-0.95,1.149)
TO-92-3_L4.8-W3.7-P1.27-L
  rect 2.032x2.032 hole 0.914: 1(-2.54,0)
  oval 2.032x2.032 hole 0.914: 2(0,0) 3(2.54,0)
TO-92-3_L5.1-W4.1-P1.27-L
  rect 1.2x2 hole 0.7: 1(-1.88,-0.046)
  oval 1.2x2 hole 0.7: 2(0,0) 3(1.8,0)

## Nets
As in the schematic, except:
+3.3VREF: C16.1 NOREF#18.1 R25.2 R26.2 R46.1 R55.2 R56.2 U6.3
+5VREF: C15.1 NOREF.1 R17.2 R31.2 R53.1 U7.3
+7V: C6.1 C14.1 C17.1 NOREF#22.1 R17.1 R25.1 R41.2 U2.1 U3.8 U5.8
GND: C1.2 C2.1 C3.1 C4.2 C5.2 C7.1 C8.2 C11.1 C18.2 C19.2 C20.1 D1.1 NOREF#4.1 NOREF#5.2 NOREF#12.1 NOREF#13.2 R6.1 R10.1 R23.2 R24.1 U1.5 X2.1 X3.2 Y1.2 Y2.2 Y3.2
GND1: C6.2 C14.2 C15.2 C16.2 C17.2 D3.2 D4.2 NOREF#2.2 NOREF#8.1 NOREF#10.1 NOREF#11.2 NOREF#14.2 NOREF#15.1 NOREF#16.1 NOREF#17.2 NOREF#20.3 NOREF#24.1 NOREF#25.1 R15.1 R19.2 R24.2 R27.1 R28.1 R33.1 R39.1 R51.2 U2.2 U3.4 U4.2 U4.6 U5.4 U6.2 U7.2
$3N6313: NOREF#21.2 R39.2 SW1.3 VR1.3
$3N6315: NOREF#6.1 R41.1 SW2.3 VR1.1 VR1.2
$3N24711: C10.1 NOREF#9.1 R7.1 R9.1 R35.2 R48.2 TP2.1 U1.4

Pads without a net: NOREF#3 1; NOREF#7 1; NOREF#19 1; NOREF#23 1

## Via types
v1: diameter 0.61, hole 0.305, Top Layer to Bottom Layer, 82 vias

## Routing (per net, layer and track width the routed paths; a pad name or vN(x,y) marks a point on that pad's centre or on a via; arc(x,y) is an arc through that point)
+3.3VREF: length 42.1
  Top Layer w1.27: R46.1 26.65,19.3 C16.1 ; 24.64,19.32 NOREF#18.1 R25.2 24.62,26.67 U6.3 20.34,24.45 R26.2 19.24,21.04 18.52,20.32 15.75,20.32 14.73,21.34 14.73,26.67 13.34,28.06 R56.2 R55.2
  Top Layer w1.524: 24.64,19.32 R46.1
+5VREF: length 29.8
  Top Layer w0.762: NOREF.1 46.23,25.38 C15.1 ; v1(51.56,23.11) 51.56,13.8 R53.1
  Top Layer w1.016: R31.2 42.44,25.44 U7.3 45.99,28.19 R17.2 46.23,25.42 C15.1
  Bottom Layer w0.762: v1(51.56,23.11) 46.48,23.11 NOREF.1
+7V: length 135.8
  Top Layer w0.762: C17.1 43.67,12.57 43.92,12.32
  Top Layer w1.016: C6.1 69.34,27.9 69.34,20.34 R41.2 ; v1(108.16,28.19) 108.16,26.06 U3.8
  Top Layer w1.524: C17.1 43.67,15.87 44.82,17.02 47.24,17.02 48.51,18.29 48.51,28.96 47.51,29.96 R17.1 46.23,32.54 43.94,34.82 32.54,34.82 26.4,28.69 R25.1
  Top Layer w2.032: C6.1 65.49,31.75 U2.1
  Bottom Layer w1.524: v1(44.96,33.78) 45.97,34.8 NOREF#22.1 U2.1
  Bottom Layer w2.032: C6.1 66,31.46 68.83,34.29 102.06,34.29 v1(108.16,28.19)
GND: length 69.6
  Top Layer w0.254: 24.66,54.74 24.58,54.66
  Top Layer w0.508: U1.5 24.66,54.74
  Top Layer w0.762: 14.22,57.15 16.29,57.15 R6.1 ; C7.1 14.73,61.82 ; C8.2 14.22,59.55
  Top Layer w1.016: R24.1 42.67,39.39 v1(42.67,58.67) ; R10.1 24.58,53.55 v1(24.58,55.62) v1(24.58,59.3) C11.1 24.58,64.06 23.11,65.53
  Top Layer w2.54: 118.87,38.35 118.87,31.9 NOREF#12.1 NOREF#5.2
  vias: v1(4.06,68.33) v1(8.38,55.88) v1(12.7,57.66) v1(14.73,68.33) v1(14.73,63.5) v1(22.35,68.58) v1(22.86,66.8) v1(46.74,53.85) v1(46.74,48.77) v1(46.74,43.94) v1(53.85,54.1) v1(54.36,45.15) v1(57.66,45.12) v1(57.66,41.4) v1(60.2,54.37) v1(67.56,38.1) v1(86.61,42.67) v1(86.61,38.86) v1(90.17,68.58) v1(93.98,40.83) v1(97.54,68.58) v1(97.54,38.35) v1(102.87,68.58) v1(102.87,38.35) v1(107.19,68.58) v1(109.73,37.85) v1(112.31,68.52) v1(114.09,37.85) v1(115.23,58.97) v1(115.23,47.03) v1(116.64,68.52)
GND1: length 2.4
  Top Layer w0.508: 22.86,17.27 v1(21.65,17.27) U4.2
  vias: v1(16.19,11.92) v1(22.61,32.26) v1(22.61,11.94) v1(25.85,32.26) v1(26.67,14.54) v1(28.7,19.56) v1(35.05,27.43) v1(39.62,22.1) v1(40.64,26.16) v1(41.91,18.29) v1(43.05,31.52) v1(44.11,25.6) v1(59.44,23.88) v1(59.44,16.76) v1(59.44,9.4) v1(65.79,16.76) v1(65.79,9.4) v1(75.76,9.4) v1(77.95,22.77) v1(82.55,13.46) v1(84.33,22.1) v1(86.61,30.48) v1(86.87,17.78) v1(89.41,22.1) v1(93.98,30.48) v1(106.17,27.47) v1(106.17,25.4)
VIN: length 65.5
  Top Layer w1.016: R38.2 53.83,37.08 48.01,37.08 44.96,40.13 44.96,56.13 51.69,62.87
  Top Layer w1.524: R1.2 29.13,65.7 29.97,66.55 40.37,66.55 R2.1 46.72,66.57 50.42,62.87 X1.1
ISEN: length 18.1
  Top Layer w0.508: TP9.1 30.54,8.18 32,9.65 R22.1
  Top Layer w0.762: R47.2 34.48,1.78 TP9.1
VOCV+: length 65.3
  Top Layer w1.016: R12.1 82.04,42.92 TP8.1
  Bottom Layer w1.016: v1(27.34,49.39) 29.52,51.56 79.01,51.56 v1(81.81,48.77) 82.05,48.53 TP8.1
VOUT+: length 80.7
  Top Layer w0.762: R52.1 78.49,6.6 90.17,18.29 v1(102.62,18.29)
  Bottom Layer w1.016: Y3.1 112.01,40.17 v1(112.01,24.11) 108.44,24.11 v1(102.62,18.29)
$3N1094: length 10.6
  Top Layer w0.762: U1.1 20.52,59.13 v1(20.52,61.83) 20.5,61.82 C7.2
  Bottom Layer w1.524: v1(20.52,61.83) 18.54,63.81 TP1.1
$3N1131: length 5
  Top Layer w0.508: C8.1 18.45,57.31 R6.2 21.09,57.26 U1.2
$3N1241: length 1.8
  Top Layer w0.762: R9.2 R8.1
$3N1420: length 7.7
  Top Layer w0.508: R34.1 24.78,47.39 J4.1
  Top Layer w0.762: J4.2 J4.1 24.38,47.5 R8.2
$3N1514: length 12.5
  Top Layer w1.016: R1.1 28.98,61.82 v1(26.58,61.82) 26.65,61.75 U1.8 29.14,58.55 C12.2
  Bottom Layer w1.524: v1(26.58,61.82) 22.53,61.82 v1(22.52,61.83)
$3N1540: length 8.8
  Top Layer w0.508: U1.7 30.73,57.28 31.15,57.7 C12.1
  Top Layer w1.524: R4.1 C12.1
$3N1601: length 12
  Top Layer w0.762: 35.86,51.55 36.58,52.27 36.58,58.44 R4.2
  Top Layer w1.524: R2.2 38.48,58.53 R4.2
$3N1728: length 7.8
  Top Layer w0.508: v1(36.31,47.94) 36.31,48.62 Q1.3
  Bottom Layer w0.762: v1(30.13,47.93) 30.14,47.94 v1(36.31,47.94)
$3N1757: length 3.8
  Top Layer w0.762: Q1.5 34.47,51.8 34.47,55.23
$3N2008: length 11.5
  Top Layer w1.524: L1.1 38.75,48.16 R43.1 36.31,40.29 D1.2
$3N2012: length 8.4
  Top Layer w1.016: R11.2 TP7.1
  Bottom Layer w1.016: v1(75.67,48.51) 75.67,42.94 TP7.1
$3N3426: length 5.9
  Top Layer w0.508: U3.2 99.59,24.77 R13.2 R16.1
$3N3428: length 6.2
  Top Layer w0.508: 102.64,23.5 99.86,23.5 R14.2 R15.2
$3N3448: length 2.4
  Top Layer w0.762: U3.1 102.62,26.06 R45.1
$3N3452: length 90.6
  Top Layer w0.508: R45.2 103.9,30.46 104.65,29.72 104.65,17.51 104.14,17
  Top Layer w0.762: R16.2 97.28,27.51 97.28,29.46 98.28,30.46 R45.2 ; R47.1 75.95,1.78 90.93,16.76 104.38,16.76 R40.1
$3N3515: length 21.4
  Top Layer w1.016: R40.2 D3.1 106.97,9.4 116.33,9.4 117.05,10.12 117.05,12.12 J1.1
  Top Layer w1.778: J1.1 J1.2
$3N5937: length 16.6
  Top Layer w0.762: R13.1 96.7,25.65 84.96,25.65 82.04,28.58
$3N5942: length 23.9
  Top Layer w0.762: R14.1 96.43,23.62 80.77,23.62 SW2.2
$3N5986: length 9.8
  Top Layer w1.016: R12.2 82.28,37.88 82.28,37.85 ; 82.28,37.85 82.04,37.61 SW1.1 ; 82.28,37.85 82.03,38.1 C13.1
$3N5991: length 8.9
  Top Layer w1.016: SW2.1 R11.1 77.72,38.12 C13.2
$3N6177: length 16
  Top Layer w1.016: R42.2 D4.1
  Top Layer w1.778: J2.1 J2.2
  Bottom Layer w1.016: D4.1 116.98,4.72 J2.1
$3N6196: length 6.5
  Top Layer w0.508: R18.2 111.9,22.22 U3.5
  Top Layer w0.762: R18.2 112.01,19.61 R19.1
$3N6313: length 17.5
  Top Layer w1.016: NOREF#21.2 80.73,15.28 VR1.3 R39.2
  Bottom Layer w1.016: VR1.3 80.73,24.72 SW1.3
$3N6315: length 17.8
  Top Layer w1.016: VR1.1 75.73,26.12 SW2.3 ; VR1.1 R41.1 ; VR1.1 75.73,15.28 NOREF#6.1 ; VR1.1 VR1.2
$3N6870: length 2.3
  Top Layer w0.762: R7.2 12.37,49.91 C9.1
$3N24683: length 8.9
  Top Layer w0.254: TP4.1 29.01,56.01 26.65,56.01
  Top Layer w1.016: TP4.1 30.13,54.89 R44.1
$3N24701: length 9.5
  Top Layer w0.508: C10.2 15.83,54.18 17.65,56.01 21.1,56.01
  Top Layer w0.762: C9.2 C10.2
$3N24711: length 42.1
  Top Layer w0.254: TP2.1 14.48,43.94 NOREF#9.1 23.88,34.54 v1(28.7,34.54)
  Top Layer w0.508: U1.4 18.73,54.74 R35.2 18.47,54.54 16.26,52.32 14.77,52.32 C10.1
  Top Layer w0.762: R9.1 14.45,47.5 14.39,47.56 ; 14.39,47.56 14.39,44.79 TP2.1 ; 14.39,47.56 R7.1 14.39,51.94 C10.1
  Bottom Layer w0.254: v1(30.73,29.46) 30.73,32.51 v1(28.7,34.54)
$3N24744: length 2.8
  Top Layer w1.016: R38.1 U2.3
$3N33315: length 3.1
  Top Layer w0.508: R35.1 21.57,52.54 R10.2
$3N34791: length 12.4
  Top Layer w0.508: R42.1 107.95,18.53 107.95,18.54 107.59,18.9 106.17,18.9 105.81,19.26 105.81,22.75 106.55,23.5 108.18,23.5
  Top Layer w0.762: U3.7 108.18,23.5
$3N34794: length 8.4
  Top Layer w1.27: R26.1 16.66,23.93 U6.1 16.66,30.62 R27.2
$3N34796: length 2.6
  Top Layer w0.254: U4.3 21.54,18.22 R46.2
$3N34806: length 8.3
  Top Layer w1.27: R31.1 38.76,24.5 U7.1 38.88,28.27 R33.2
$3N34809: length 9
  Top Layer w0.254: TP6.1 20.45,12.1 U4.1
  Top Layer w1.016: TP6.1 20.63,7.41 R32.1
$3N34810: length 14
  Top Layer w0.508: TP5.1 33.27,11.92 R20.1
  Top Layer w1.016: TP5.1 24.69,9.47 R32.2
$3N34811: length 5.8
  Top Layer w0.254: 37.58,10.99 36.23,10.99 R20.2 35.29,12.22 R21.1
$3N34816: length 6.3
  Top Layer w0.254: R28.2 35.29,9.37 R22.2 35.42,9.78 U5.3
$3N34819: length 7.2
  Top Layer w0.254: 38.38,12.32 37.19,12.32 R21.2
  Top Layer w0.762: R30.1 R21.2
$3N34820: length 19.6
  Top Layer w0.762: J3.1 J3.2 31.12,17.53 R30.2 ; J3.1 30.73,20.46 R48.1 ; J3.1 31.12,20.07 R49.2
$3N34821: length 7.1
  Top Layer w0.508: v1(48.21,9.65) 48.09,9.78 U5.6
  Bottom Layer w0.254: v1(48.21,9.65) v1(48.21,12.45)
$3N34822: length 12.1
  Top Layer w0.254: D5.2 50.43,9.87 R54.1
  Top Layer w0.508: U5.7 49.58,11.05 50.21,10.41 R54.1
$3N34823: length 2
  Top Layer w0.762: R50.1 54.86,20.05 D5.1
$3N34824: length 12.8
  Bottom Layer w0.762: v1(40.13,20.07) 52.59,20.07 52.85,20.32
  vias: v1(52.85,20.07)
$3N34825: length 10.7
  Top Layer w0.508: R52.2 R51.1 50.29,6.68 50.29,7.3 49.59,8 44.43,8 U5.5
$3N34829: length 11.6
  Top Layer w0.508: J6.1 3.62,21.42 R55.1
  Top Layer w1.524: J6.1 J6.2 10.28,21.24 R36.1
$3N34830: length 6.9
  Top Layer w0.254: R36.2 15.29,18.22 U4.4
$3N34833: length 17.2
  Top Layer w0.254: v1(8.89,24.64) R56.1
  Top Layer w1.524: R37.1 J7.2 J7.1
  Bottom Layer w0.254: J7.2 8.89,19.05 v1(8.89,24.64)
$3N34834: length 6
  Top Layer w0.254: U4.5 18.05,17.17 15.64,17.17 14.99,16.51 R37.2

## Copper pours and planes (outline as drawn; the poured copper is in the pictures)
GND on Top Layer: 45.83,55.18 67.55,55.18 67.55,69.28 120.65,69.34 120.65,36.83 83.75,36.83 83.75,44.7 73.91,44.7 73.91,33.53 73.91,33.53 61.21,33.53 61.21,37.85 49.28,37.85 45.83,40.44
GND on Top Layer: 77.22,44.96 80.52,44.96 80.52,39.12 77.22,39.12
GND on Top Layer: 2.79,46.23 2.79,69.34 24.38,69.34 24.38,63.25 15.24,63.25 15.24,56.39 10.92,56.39 10.92,46.23
GND on Bottom Layer: 0,71.12 121.92,71.12 121.92,36.87 0,36.87
GND1 on Top Layer: 32,8.89 39.43,8.89 39.37,8.95 39.37,12.95 37.49,12.95 36.32,14.12 36.32,19.3 36.65,19.63 37.21,19.63 37.21,19.05 40.96,19.05 40.96,21.01 40.89,21.08 32.23,21.08 32.23,30.28 29.82,30.28 33.31,33.78 37.85,33.78 37.85,23.37 42.17,23.37 42.17,24.09 43.25,25.17 43.25,27.43 45.49,27.43 45.49,22.61 47.75,22.61 47.75,18.8 46.78,17.82 44.34,17.82 42.53,16.01 42.53,7.51 49.21,7.51 49.21,5.79 79.1,5.79 75.59,2.29 34.73,2.29 31.12,5.9 31.12,8.13 31.24,8.13
GND1 on Top Layer: 75.73,20.32 118.25,20.32 118.25,-0.06 75.73,-0.06
GND1 on Top Layer: 118.11,18.03 113.31,18.03 113.19,18.16 113.19,25.13 112.37,25.13 112.27,25.23 112.27,26.82 109.69,26.82 109.22,27.29 109.22,32.26 111.25,32.26 118.11,23.7
GND1 on Top Layer: 18.29,28.69 18.29,34.18 29.07,34.18 29.09,34.16 29.09,32.65 26.16,29.72 23.72,29.72 23.62,29.61 23.62,28.19 19.81,28.19 19.3,27.69 19.3,24.64 17.78,24.64 17.78,28.18
GND1 on Top Layer: 39.88,33.72 43.69,33.72 45.24,32.17 45.24,28.98 45.21,28.96 41.6,28.96 41.6,25.85 40.89,25.15 39.88,25.15
GND1 on Top Layer: 6.35,13.72 6.35,14.69 7.87,14.69 7.87,14.99 8.13,15.24 13.46,15.24 13.46,16 15.51,16 16.01,16.5 19.4,16.5 19.56,16.34 19.56,13.46 19.05,13.46 19.05,10.41 19.5,10.41 19.56,10.47 19.56,6.35 19.81,6.1 23.88,6.1 23.88,7.62 26.16,9.91 26.16,11.43 32.26,11.43 32.26,10.16 31.59,10.16 30.03,8.59 29.98,4.32 30.99,4.32 34.04,1.27 36.57,1.27 36.58,1.26 36.58,0.25 12.95,0.25 12.95,13.72
GND1 on Top Layer: 19.81,17.78 21.59,17.78 22.08,18.27 22.08,18.29 27.69,18.29 27.69,20.32 27.63,20.37 25.59,20.37 25.59,27.69 26.66,27.69 29.19,30.21 29.72,30.21 29.72,16.51 29.82,16.61 34.8,16.61 34.8,15.24 34.7,15.14 32.26,15.14 32.26,12.19 26.16,12.19 26.16,13.46 23.88,13.46 23.88,9.64 22.45,8.22 21.34,8.22 21.34,16.76 19.81,16.76
GND1 on Top Layer: 99.21,22.85 104.65,22.85 104.65,18.68 99.21,18.68
GND1 on Top Layer: 45.72,35.05 98.3,35.05 98.3,6.6 45.72,6.6
GND1 on Top Layer: 82.04,36.58 112.01,36.58 112.01,24.11 82.04,24.11
GND1 on Bottom Layer: 0,36.9 121.92,36.9 121.92,0 0,0
VIN on Top Layer: 27.94,69.34 45.97,69.34 45.97,62.74 27.94,62.74
VIN on Top Layer: 44.76,69.34 67.06,69.34 67.06,55.63 44.76,55.63
VOCV+ on Top Layer: 79.25,55.63 89.66,55.63 89.66,46.48 79.25,46.48
VOUT+ on Top Layer: 104.9,66.8 114.08,66.8 114.08,39.2 104.9,39.2
VOUT+ on Top Layer: 90.17,57.15 99.81,57.15 99.81,41.98 90.17,41.98
VOUT+ on Top Layer: 99.31,66.8 104.9,66.8 104.9,45.72 99.31,45.72
$3N1757 on Top Layer: 32.26,52.32 35.05,52.32 35.05,44.7 32.26,44.7
$3N2012 on Top Layer: 48.01,52.58 77.65,52.58 77.65,46.48 48.01,46.48

## Text on the board
Top Silkscreen Layer: SDA | SCL | GND1 | GND | V | I | 侯卜文 姜宏淳 李昱林 杨承旭 | 第22组 | 稳流源电路
